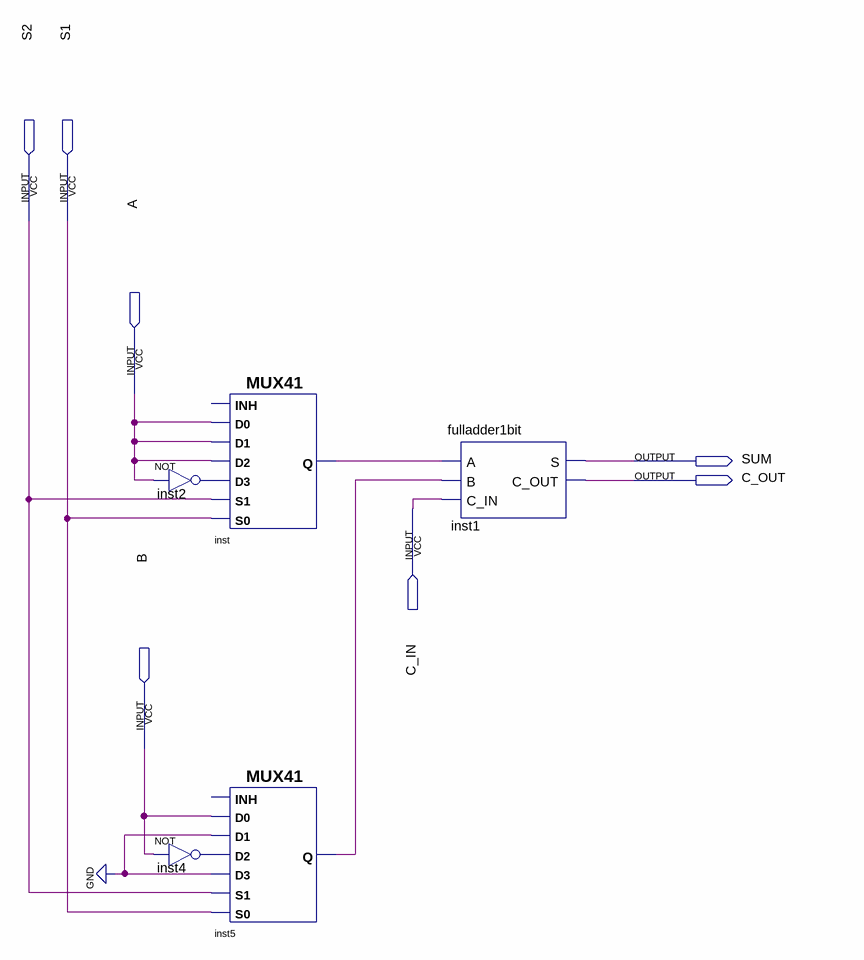
[diagram p0: schematic sheet]
// Quartus schematic arithcircuit1bit.bdf as structural Verilog: 5 symbols, 7 pins
module arithcircuit1bit (
  input  S2,
  input  S1,
  input  A,
  input  C_IN,
  input  B,
  output SUM,
  output C_OUT
);

  wire inst2_out, inst4_out, inst5_q, inst_q;

  not inst2 (inst2_out, A);
  not inst4 (inst4_out, B);
  MUX41 inst (.S0(S1), .D2(A), .S1(S2), .D3(inst2_out), .D0(A), .D1(A), .Q(inst_q));  // open: INH
  MUX41 inst5 (.S0(S1), .D2(inst4_out), .S1(S2), .D3(1'b0), .D0(B), .D1(1'b0), .Q(inst5_q));  // open: INH
  fulladder1bit inst1 (.A(inst_q), .B(inst5_q), .C_IN(C_IN), .S(SUM), .C_OUT(C_OUT));
endmodule
